# Altium schematic sheet Connector_Card2.SchDoc
size A4; SheetNumber: 4; SheetTotal: 4
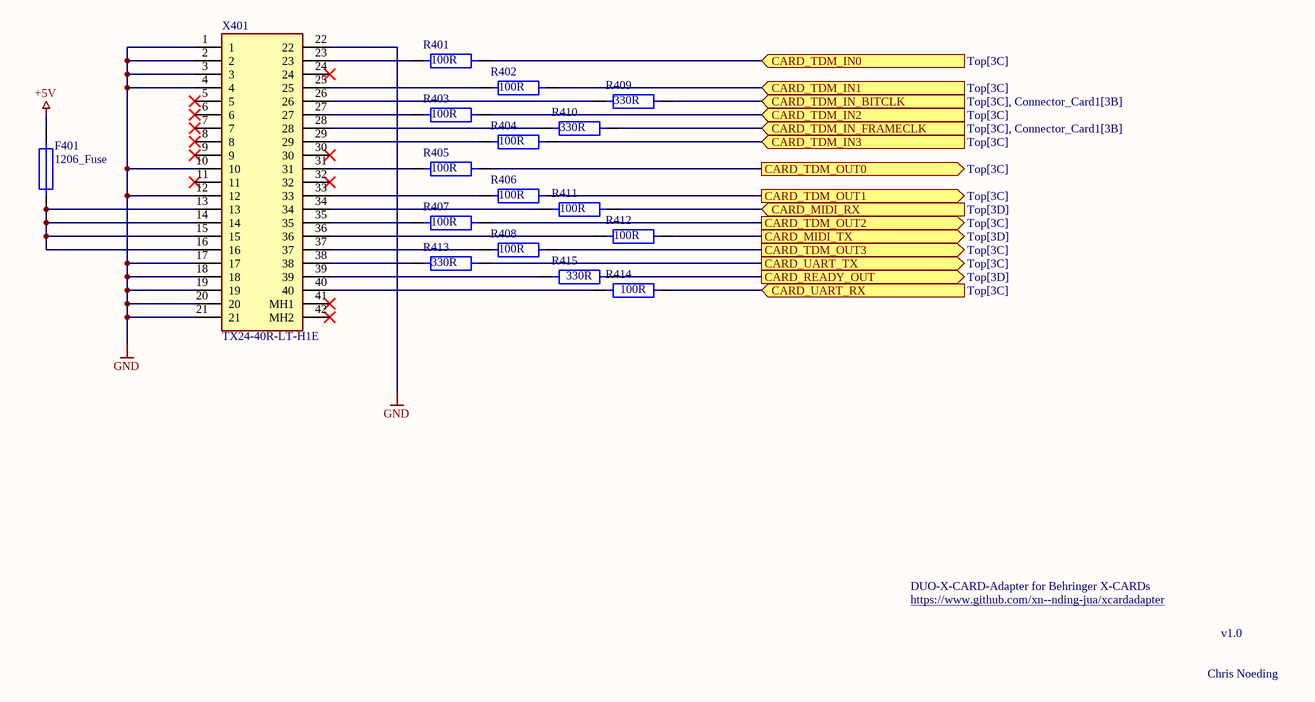
[diagram p0: Connector_Card2.SchDoc]

## Parts
F401  1206_Fuse  [1206]
R401  100R  [1206]
R402  100R  [1206]
R403  100R  [1206]
R404  100R  [1206]
R405  100R  [1206]
R406  100R  [1206]
R407  100R  [1206]
R408  100R  [1206]
R409  330R  [1206]
R410  330R  [1206]
R411  100R  [1206]
R412  100R  [1206]
R413  330R  [1206]
R414  100R  [1206]
R415  330R  [1206]
X401  TX24-40R-LT-H1E  [TX2440RLTH1E]

## Ports
CARD_MIDI_RX (in, see Top[3D]), CARD_MIDI_TX (out, see Top[3D]), CARD_READY_OUT (out, see Top[3D]), CARD_TDM_IN0 (in, see Top[3C]), CARD_TDM_IN1 (in, see Top[3C]), CARD_TDM_IN2 (in, see Top[3C]), CARD_TDM_IN3 (in, see Top[3C]), CARD_TDM_IN_BITCLK (in, see Top[3C], Connector_Card1[3B]), CARD_TDM_IN_FRAMECLK (in, see Top[3C], Connector_Card1[3B]), CARD_TDM_OUT0 (out, see Top[3C]), CARD_TDM_OUT1 (out, see Top[3C]), CARD_TDM_OUT2 (out, see Top[3C]), CARD_TDM_OUT3 (out, see Top[3C]), CARD_UART_RX (in, see Top[3C]), CARD_UART_TX (out, see Top[3C])

## Nets
+5V: F401.2
GND: X401.1 X401.2 X401.3 X401.4 X401.10 X401.12 X401.17 X401.18 X401.19 X401.20 X401.21 X401.22
CARD_MIDI_RX: R411.2 ; port CARD_MIDI_RX
CARD_MIDI_TX: R412.2 ; port CARD_MIDI_TX
CARD_READY_OUT: R415.2 ; port CARD_READY_OUT
CARD_TDM_IN0: R401.2 ; port CARD_TDM_IN0
CARD_TDM_IN1: R402.2 ; port CARD_TDM_IN1
CARD_TDM_IN2: R403.2 ; port CARD_TDM_IN2
CARD_TDM_IN3: R404.2 ; port CARD_TDM_IN3
CARD_TDM_IN_BITCLK: R409.2 ; port CARD_TDM_IN_BITCLK
CARD_TDM_IN_FRAMECLK: R410.2 ; port CARD_TDM_IN_FRAMECLK
CARD_TDM_OUT0: R405.2 ; port CARD_TDM_OUT0
CARD_TDM_OUT1: R406.2 ; port CARD_TDM_OUT1
CARD_TDM_OUT2: R407.2 ; port CARD_TDM_OUT2
CARD_TDM_OUT3: R408.2 ; port CARD_TDM_OUT3
CARD_UART_RX: R414.2 ; port CARD_UART_RX
CARD_UART_TX: R413.2 ; port CARD_UART_TX
NetF401_1: F401.1 X401.13 X401.14 X401.15 X401.16
NetR401_1: R401.1 X401.23
NetR402_1: R402.1 X401.25
NetR403_1: R403.1 X401.27
NetR404_1: R404.1 X401.29
NetR405_1: R405.1 X401.31
NetR406_1: R406.1 X401.33
NetR407_1: R407.1 X401.35
NetR408_1: R408.1 X401.37
NetR409_1: R409.1 X401.26
NetR410_1: R410.1 X401.28
NetR411_1: R411.1 X401.34
NetR412_1: R412.1 X401.36
NetR413_1: R413.1 X401.38
NetR414_1: R414.1 X401.40
NetR415_1: R415.1 X401.39

Not connected (* = marked no-connect by the designer): X401 5* 6* 7* 8* 9* 11* 24* 30* 32* 41(MH1)* 42(MH2)*

## Notes on the sheet
- DUO-X-CARD-Adapter for Behringer X-CARDs
- https://www.github.com/xn--nding-jua/xcardadapter
- v1.0
- Chris Noeding

## Library data of the parts
R401-R404 R407-R415 = 1206_R: SMA-ArtikelNr: *
R405 R406 = 1206_R: 330R; SMA-ArtikelNr: *
X401 = TX24-40R-LT-H1E: Connector; Manufacturer_Name: JAE; Datasheet Link: https://www.jae.com/direct/topics/topics_file_download/topics_id=66739&ext_no=06&index=0&_lang=en&v=; Height: 9.2mm; Manufacturer_Part_Number: TX24-40R-LT-H1E; Mouser Part Number: 656-TX24-40R-LT-H1E; Mouser Price/Stock: https://www.mouser.co.uk/ProductDetail/JAE-Electronics/TX24-40R-LT-H1E?qs=qo47cMy2QCeuMLTrRKCbyg%3D%3D
F401 = 1206_Fuse: SMA-ArtikelNr: *